# Altium schematic sheet ifamp2.SchDoc
size A; SheetNumber: 5; SheetTotal: 8
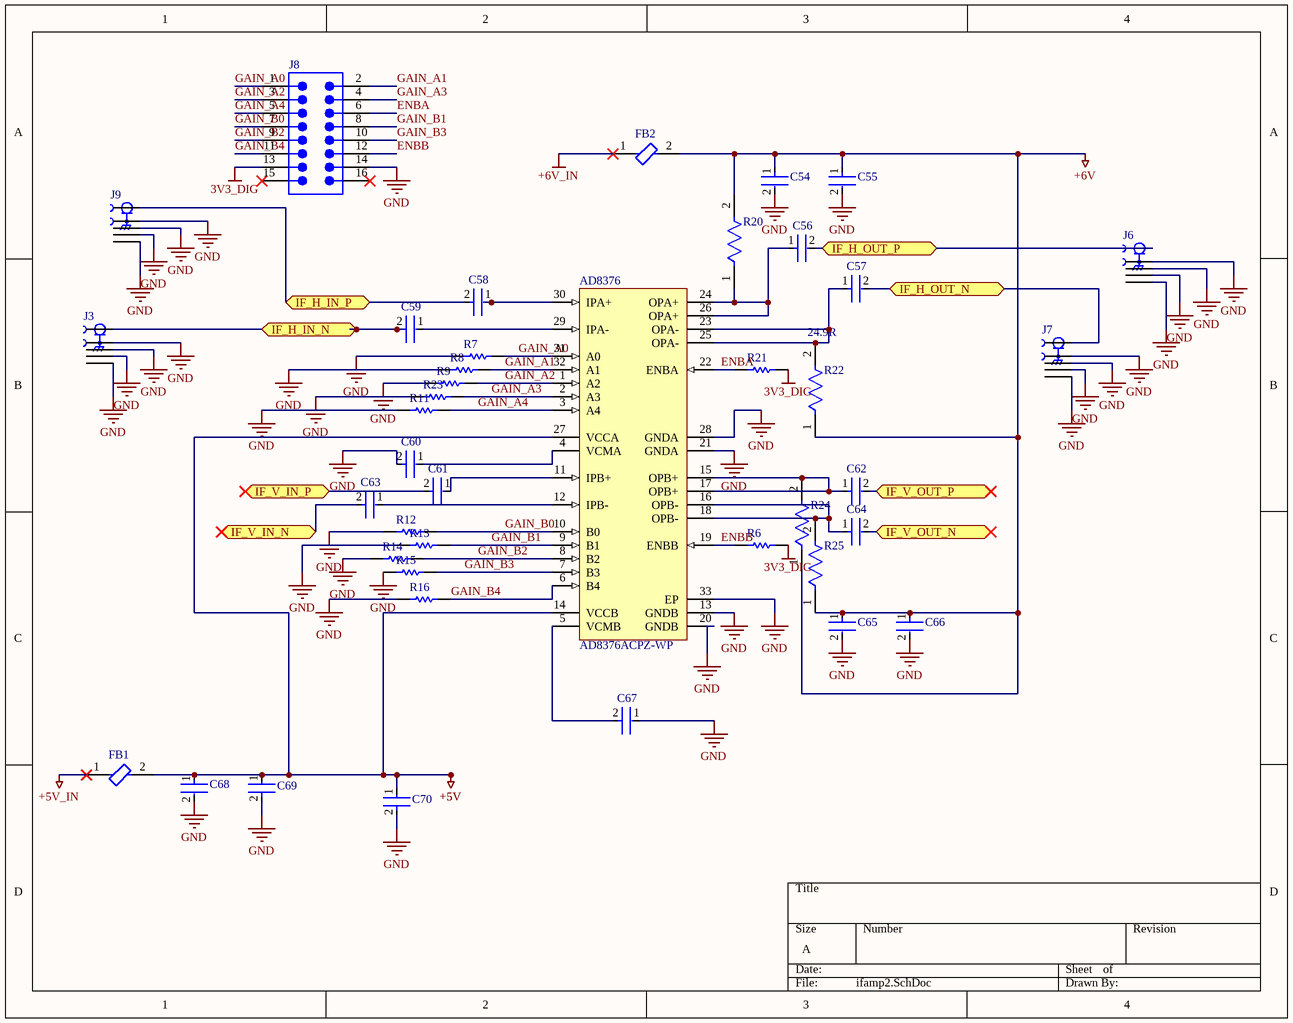
[diagram p0: ifamp2.SchDoc]

## Parts
AD8376  AD8376ACPZ-WP  [ADI-CP-32-3_N]
C54  (no value)  [FP-GRM155-0_05-IPC_C]
C55  (no value)  [FP-GRM21B-0_15-IPC_C]
C56  (no value)  [FP-GRM155-0_05-IPC_C]
C57  (no value)  [FP-GRM155-0_05-IPC_C]
C58  (no value)  [FP-GRM15-MFG]
C59  (no value)  [FP-GRM15-MFG]
C60  (no value)  [FP-GRM15-MFG]
C61  (no value)  [FP-GRM15-MFG]
C62  (no value)  [FP-GRM155-0_05-IPC_C]
C63  (no value)  [FP-GRM15-MFG]
C64  (no value)  [FP-GRM155-0_05-IPC_C]
C65  (no value)  [FP-GRM21B-0_15-IPC_C]
C66  (no value)  [FP-GRM155-0_05-IPC_C]
C67  (no value)  [FP-GRM15-MFG]
C68  (no value)  [FP-GRM21B-0_15-IPC_C]
C69  (no value)  [FP-GRM15-MFG]
C70  (no value)  [FP-GRM15-MFG]
FB1  (no value)  [FP-BLM18-0_15-t0_8-IPC_B]
FB2  (no value)  [FP-BLM18-0_15-t0_8-IPC_B]
J3  (no value)  [TE_CONSMA003.062]
J6  (no value)  [TE_CONSMA003.062]
J7  (no value)  [TE_CONSMA003.062]
J8  (no value)  [61301621121]
J9  (no value)  [TE_CONSMA003.062]
R6  (no value)  [RESC1005X40X25LL05T10]
R7  (no value)  [RESC1005X40X25LL05T10]
R8  (no value)  [RESC1005X40X25LL05T10]
R9  (no value)  [RESC1005X40X25LL05T10]
R11  (no value)  [RESC1005X40X25LL05T10]
R12  (no value)  [RESC1005X40X25LL05T10]
R13  (no value)  [RESC1005X40X25LL05T10]
R14  (no value)  [RESC1005X40X25LL05T10]
R15  (no value)  [RESC1005X40X25LL05T10]
R16  (no value)  [RESC1005X40X25LL05T10]
R20  (no value)  [FP-RC0603-0_55-IPC_A]
R21  (no value)  [RESC1005X40X25LL05T10]
R22  Resistance: 24.9R  [FP-RC0603-0_55-IPC_A]
R23  (no value)  [RESC1005X40X25LL05T10]
R24  (no value)  [FP-RC0603-0_55-IPC_A]
R25  (no value)  [FP-RC0603-0_55-IPC_A]

## Ports
IF_H_IN_N (bidir), IF_H_IN_P (bidir), IF_H_OUT_N (bidir), IF_H_OUT_P (bidir), IF_V_IN_N (bidir), IF_V_IN_P (bidir), IF_V_OUT_N (bidir), IF_V_OUT_P (bidir)

## Nets
3V3_DIG: J8.13 R6.2 R21.2
+5V: AD8376.14(VCCB) AD8376.27(VCCA) C68.1 C69.1 C70.1 FB1.2
+5V_IN: FB1.1
+6V: C54.1 C55.1 C65.1 C66.1 FB2.2 R20.2 R22.1 R24.1 R25.1
+6V_IN: FB2.1
GND: AD8376.13(GNDB) AD8376.20(GNDB) AD8376.21(GNDA) AD8376.28(GNDA) AD8376.33(EP) C54.2 C55.2 C60.2 C65.2 C66.2 C67.1 C68.2 C69.2 C70.2 J3.2(SH) J3.3(SH) J3.4(SH) J3.5(SH) J6.2(SH) J6.3(SH) J6.4(SH) J6.5(SH) J7.2(SH) J7.3(SH) J7.4(SH) J7.5(SH) J8.14 J9.2(SH) J9.3(SH) J9.4(SH) J9.5(SH) R7.1 R8.1 R9.1 R11.1 R12.1 R13.1 R14.1 R15.1 R16.1 R23.1
ENBA: AD8376.22(ENBA) J8.6 R21.1
ENBB: AD8376.19(ENBB) J8.12 R6.1
GAIN_A0: AD8376.31(A0) J8.1 R7.2
GAIN_A1: AD8376.32(A1) J8.2 R8.2
GAIN_A2: AD8376.1(A2) J8.3 R9.2
GAIN_A3: AD8376.2(A3) J8.4 R23.2
GAIN_A4: AD8376.3(A4) J8.5 R11.2
GAIN_B0: AD8376.10(B0) J8.7 R12.2
GAIN_B1: AD8376.9(B1) J8.8 R13.2
GAIN_B2: AD8376.8(B2) J8.9 R14.2
GAIN_B3: AD8376.7(B3) J8.10 R15.2
GAIN_B4: AD8376.6(B4) J8.11 R16.2
IF_H_IN_N: C59.2 J3.1(SIG) ; port IF_H_IN_N
IF_H_IN_P: C58.2 J9.1(SIG) ; port IF_H_IN_P
IF_H_OUT_N: C57.2 J7.1(SIG) ; port IF_H_OUT_N
IF_H_OUT_P: C56.2 J6.1(SIG) ; port IF_H_OUT_P
IF_V_IN_N: C63.2 ; port IF_V_IN_N
IF_V_IN_P: C61.2 ; port IF_V_IN_P
IF_V_OUT_N: C64.2 ; port IF_V_OUT_N
IF_V_OUT_P: C62.2 ; port IF_V_OUT_P
NetAD8376_4: AD8376.4(VCMA) C60.1
NetAD8376_5: AD8376.5(VCMB) C67.2
NetAD8376_11: AD8376.11(IPB+) C61.1
NetAD8376_12: AD8376.12(IPB-) C63.1
NetAD8376_15: AD8376.15(OPB+) AD8376.17(OPB+) C62.1 R24.2
NetAD8376_16: AD8376.16(OPB-) AD8376.18(OPB-) C64.1 R25.2
NetAD8376_23: AD8376.23(OPA-) AD8376.25(OPA-) C57.1 R22.2
NetAD8376_24: AD8376.24(OPA+) AD8376.26(OPA+) C56.1 R20.1
NetAD8376_29: AD8376.29(IPA-) C59.1
NetAD8376_30: AD8376.30(IPA+) C58.1

Not connected (* = marked no-connect by the designer): J8 15* 16*

## Library data of the parts
AD8376 = CMP-0291-00011-1: Ultralow Distortion IF Dual VGA, 16dB, 5V, 250mA, CP-32-3, Pb-Free, 36 Tray; Output IP3: 50dBm; Distortion (3rd): 91dBc; -3 dB BW: 700MHz; Noise Figure: 8.7dB; Distortion (2nd): 82dBc; ComponentLink1Description: Manufacturer URL; ComponentLink2Description: Datasheet; DatasheetVersion: Rev. A; ComponentLink1URL: www.analog.com; PackageVersion: Jan-2005; PackageReference: CP-32-3; ComponentLink3URL: http://www.analog.com/static/imported-files/packages/32877413525511988CP_32_3.pdf; PackageDescription: 32-Lead Lead Frame Chip Scale Package [LFCSP_VQ]; Gain: 16dB; ComponentLink3Description: Package Specification; Supply Voltage (V): 5V; ComponentLink2URL: http://www.analog.com/static/imported-files/data_sheets/AD8376.pdf; Code_JEDEC: MO-220-VHHD-2
C54 C56 C57 C62 C64 C66 = CMP-06035-003661-1: Chip Multilayer Ceramic Capacitors for General Purpose, 0402, 0.10uF, X7R, 15%, 10%, 25V; Capacitance: 100nF; Length: 1mm; Depth: 0.5mm; Dielectric: X7R; Voltage Rating: 25V; Lead Free: Lead Free; Case Code (Imperial): 0402; Voltage: 25V; Min Operating Temperature: -55°C; Tolerance: 10%; Dielectric Material: Ceramic; Voltage Rating (DC): 25V; Max Operating Temperature: 125°C; Thickness: 0.022inch; Case/Package: 0402; Height: 0.5mm; Resistor Type: Ceramic; Weight: 0.000212oz; Case Code (Metric): 1005; Package Quantity: 10000; Termination: SMD/SMT; Width: 0.02inch; Mount: Surface Mount; Packaging: Tape and Reel
C55 C65 C68 = CMP-2007-03541-2: Chip Multilayer Ceramic Capacitors for General Purpose, 0805, 10uF, X5R, 15%, 10%, 25V; Length: 2mm; Depth: 1.25mm; Termination: SMD/SMT; Voltage: 25V; Height: 1.25mm; Material: Ceramic; Thickness: 0.053inch; Radiation Hardening: No; Min Operating Temperature: -55°C; Width: 0.049inch; Package Quantity: 1; Mount: Surface Mount; Dielectric: X5R; Packaging: Tape and Reel; Capacitance: 10uF; Voltage Rating (DC): 25V; Lead Free: Lead Free; Max Operating Temperature: 85°C; Case Code (Imperial): 0805; Case/Package: 0805; Tolerance: 10%; Voltage Rating: 25V; Case Code (Metric): 2012
C58-C61 C63 C67 C69 C70 = CMP-2100-03641-2: CAP CER 0.1UF 16V X7R 0402; Manufacturer Part Number: GRM155R71C104KA88D; Manufacturer: Murata; Standoff Height: 0mm; Tolerance: 10%; Voltage Rating: 16Vdc; Material: Ceramic; Capacitance: 0.10μF; Value: 0.10μF; RoHS: TRUE; Temperature Characteristic: X7R; Octopart: https://octopart.com/grm155r71c104ka88d-murata-196880; Digikey Description: CAP CER 0.1UF 16V X7R 0402; Device Class L3: Ceramic Capacitors; Height: 0.55mm; ComponentLink2Description: Datasheet; Temperature Range Low: -55°C; Ipc Land Pattern Name: CAPC10050X219; ComponentLink2URL: https://search.murata.co.jp/Ceramy/image/img/A01X/G101/ENG/GRM155R71H471KA01-01A.pdf; Device Class L1: Passive Components; Lead Free: yes; Category: Cap; Package: GRM15; Temperature: -55°C to +125°C; Device Class L2: Capacitors; Temperature Range High: +125°C; Mouser Description: 0402 0.1 uF 16V ±10 % Tolerance X7R SMT Multilayer Ceramic Capacitor
FB1 FB2 = CMP-0686-00569-3: Chip Ferrite Bead, 0603, 220Ω @ 100MHz, 0.1Ω, 25%, 1.4A; Manufacturer Series: BLM18P; Number of Functions: 1; Shielding: Unshielded; ESR (Equivalent Series Resistance): 220R; Material: Steel; DC Resistance-Max: 100mR; Lead Free: Lead Free; Current Rating: 1.4A; Test Frequency: 100MHz; Package Quantity: 1; REACH SVHC: No SVHC; Series: BLM18P; Number of Circuits: 1; Height: 0.8mm; Number of Pins: 2; Termination: SMD/SMT; Width: 0.8mm; Max DC Current: 1.4A; Depth: 0.8mm; RoHS Compliant: Yes; Case Code (Imperial): 0603; Number of Lines: 1; Length: 1.6mm; Max Current Rating: 1.4A; Case/Package: 0603; DC Current: 1.4A; Max Operating Temperature: 125°C; Weight: 7.1E-05oz; Tolerance: 25%; Impedance: 220R; Radiation Hardening: No; Packaging: Tape and Reel; DC Resistance (DCR): 100mR; Resistance: 100mR; Min Operating Temperature: -55°C; Core Material: Ferrite; Case Code (Metric): 1608
J3 J6 J7 J9 = CONSMA003.062: Package: None; Price: None; Value: *; MP: CONSMA003.062; Availability: Unavailable
J8 = CMP-1502-01097-4: THT Vertical Pin Header WR-PHD, Pitch 2.54 mm, Dual Row, 16 pins; Gender: Male; Contact Resistance: 20mΩ; Number of Contacts: 16; Voltage Rating: 250V; Connector Type: Male Pin; Current Rating: 3A; Row Spacing: 2.54mm; Contact Mating Length: 5.9944mm; Contact Plating: Gold; Height: 8.89mm; Termination: Solder; Color: Black; Lead Pitch: 2.54mm; Max Operating Temperature: 105°C; Contact Material: Gold; Operating Supply Voltage: 250V; Orientation: Vertical; Min Operating Temperature: -40°C; Mount: Through Hole; Packaging: Bulk; RoHS: Compliant; Number of Positions: 16; Number of Pins: 16; Number of Rows: 2; Pitch: 2.54mm
R6-R9 R11-R16 R21 R23 = CMP-2002-07353-1: Part Number: RC0402FR-0710KL; Manufacturer: Yageo / Phycomp
R20 R24 R25 = CMP-03412-037812-1: RES SMD 24.9 OHM 1% 1/10W 0603; Working Voltage: 75V; Max Power Dissipation: 100mW; Voltage Rating (DC): 50V; Resistance: 24.9R; Temperature Coefficient: 100ppm/°C; Packaging: Tape and Reel; Package Quantity: 1; Construction: Rectangular; Number of Pins: 2; Resistance Tolerance: 1%; Resistor Type: Thick Film; Series: RC; Features: Moisture Resistant; Width: 0.031inch; Min Operating Temperature: -55°C; Length: 1.6mm; Tolerance: 1%; Technology: THICK FILM; Power Rating: 100mW; Case Code (Imperial): 0603; Termination: SMD/SMT; Military Standard: Not; Number of Terminations: 2; REACH SVHC: No SVHC; Lead Free: Lead Free; RoHS Compliant: Yes; Weight: 7.1E-05oz; Height: 0.45mm; Case Code (Metric): 1608; Voltage Rating: 75V; Max Operating Temperature: 155°C; Case/Package: 0603; Depth: 0.8mm
R22 = CMP-03412-037812-1: RES SMD 24.9 OHM 1% 1/10W 0603; Working Voltage: 75V; Max Power Dissipation: 100mW; Voltage Rating (DC): 50V; Temperature Coefficient: 100ppm/°C; Packaging: Tape and Reel; Package Quantity: 1; Construction: Rectangular; Number of Pins: 2; Resistance Tolerance: 1%; Resistor Type: Thick Film; Series: RC; Features: Moisture Resistant; Width: 0.031inch; Min Operating Temperature: -55°C; Length: 1.6mm; Tolerance: 1%; Technology: THICK FILM; Power Rating: 100mW; Case Code (Imperial): 0603; Termination: SMD/SMT; Military Standard: Not; Number of Terminations: 2; REACH SVHC: No SVHC; Lead Free: Lead Free; RoHS Compliant: Yes; Weight: 7.1E-05oz; Height: 0.45mm; Case Code (Metric): 1608; Voltage Rating: 75V; Max Operating Temperature: 155°C; Case/Package: 0603; Depth: 0.8mm